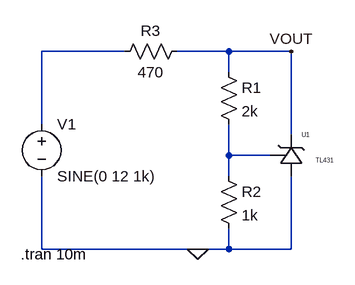
[diagram p0: schematic tl431.asc]
tl431.asc, the LTspice schematic file:
Version 4
SHEET 1 880 680
WIRE -80 32 -208 32
WIRE 80 32 0 32
WIRE 176 32 80 32
WIRE 80 64 80 32
WIRE -208 144 -208 32
WIRE 176 160 176 32
WIRE 80 192 80 144
WIRE 144 192 80 192
WIRE 80 224 80 192
WIRE -208 336 -208 224
WIRE 32 336 -208 336
WIRE 80 336 80 304
WIRE 80 336 32 336
WIRE 176 336 176 224
WIRE 176 336 80 336
FLAG 176 32 VOUT
FLAG 32 336 0
SYMBOL res 64 48 R0
SYMATTR InstName R1
SYMATTR Value 2k
SYMBOL res 64 208 R0
SYMATTR InstName R2
SYMATTR Value 1k
SYMBOL res -96 48 R270
WINDOW 0 32 56 VTop 2
WINDOW 3 0 56 VBottom 2
SYMATTR InstName R3
SYMATTR Value 470
SYMBOL voltage -208 128 R0
WINDOW 123 0 0 Left 0
WINDOW 39 0 0 Left 0
SYMATTR InstName V1
SYMATTR Value SINE(0 12 1k)
SYMBOL TL431 160 160 R0
SYMATTR InstName U1
TEXT -240 344 Left 2 !.tran 10m

The netlist it stands for:
* tl431.asc
R1 VOUT N002 2k
R2 N002 0 1k
R3 N001 VOUT 470
V1 N001 0 SINE(0 12 1k)
XU1 0 VOUT N002 TL431  ; pins A K R
.tran 10m
.lib TL431.lib
.backanno
.end